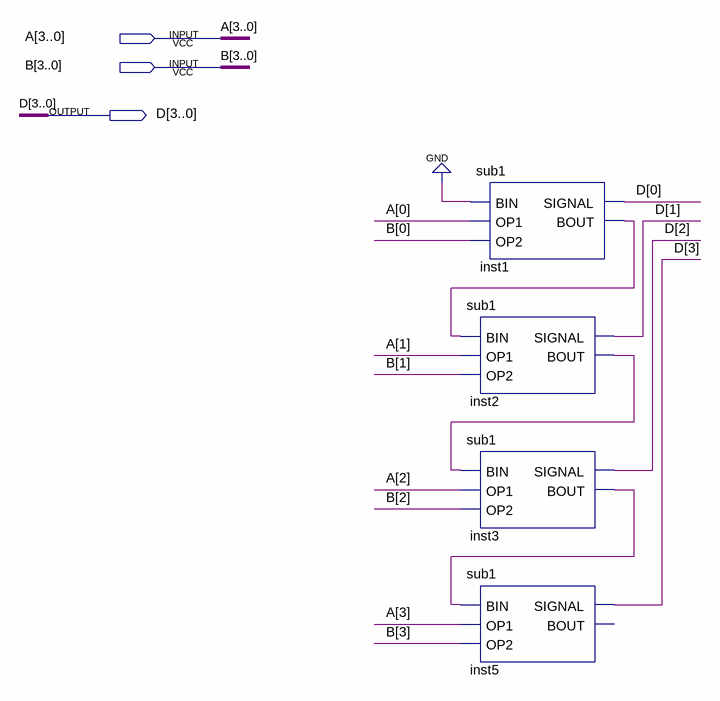
[diagram p0: schematic sheet]
// Quartus schematic sub4.bdf as structural Verilog: 4 symbols, 3 pins
module sub4 (
  input  [3:0] A,
  input  [3:0] B,
  output [3:0] D
);

  wire inst1_bout, inst2_bout, inst3_bout;

  sub1 inst1 (.BIN(1'b0), .OP1(A[0]), .OP2(B[0]), .SIGNAL(D[0]), .BOUT(inst1_bout));
  sub1 inst2 (.BIN(inst1_bout), .OP1(A[1]), .OP2(B[1]), .SIGNAL(D[1]), .BOUT(inst2_bout));
  sub1 inst3 (.BIN(inst2_bout), .OP1(A[2]), .OP2(B[2]), .SIGNAL(D[2]), .BOUT(inst3_bout));
  sub1 inst5 (.BIN(inst3_bout), .OP1(A[3]), .OP2(B[3]), .SIGNAL(D[3]));  // open: BOUT
endmodule
